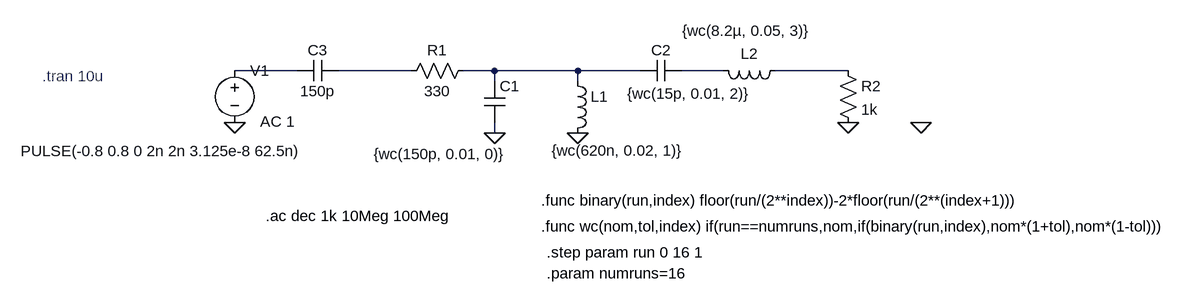
[diagram p0: schematic output filter.asc]
output filter.asc, the LTspice schematic file:
Version 4
SHEET 1 1516 680
WIRE 32 128 -64 128
WIRE 208 128 96 128
WIRE 336 128 288 128
WIRE 464 128 336 128
WIRE 560 128 464 128
WIRE 688 128 624 128
WIRE 880 128 768 128
WIRE 336 144 336 128
WIRE 464 144 464 128
WIRE 336 224 336 208
FLAG 336 224 0
FLAG 464 224 0
FLAG 880 208 0
FLAG 992 208 0
FLAG -64 208 0
SYMBOL voltage -64 112 R0
WINDOW 3 -329 140 Left 2
WINDOW 123 39 94 Left 2
WINDOW 39 0 0 Left 0
SYMATTR InstName V1
SYMATTR Value PULSE(-0.8 0.8 0 2n 2n 3.125e-8 62.5n)
SYMATTR Value2 AC 1
SYMBOL res 304 112 R90
WINDOW 0 0 56 VBottom 2
WINDOW 3 32 56 VTop 2
SYMATTR InstName R1
SYMATTR Value 330
SYMATTR SpiceLine tol=0
SYMBOL cap 320 144 R0
WINDOW 3 -170 112 Left 2
SYMATTR InstName C1
SYMATTR Value {wc(150p, 0.01, 0)}
SYMBOL ind 448 128 R0
WINDOW 3 -24 123 Left 2
SYMATTR InstName L1
SYMATTR Value {wc(620n, 0.02, 1)}
SYMBOL cap 624 112 R90
WINDOW 0 0 32 VBottom 2
WINDOW 3 36 -11 VTop 2
SYMATTR InstName C2
SYMATTR Value {wc(15p, 0.01, 2)}
SYMBOL ind 784 112 R90
WINDOW 0 5 56 VBottom 2
WINDOW 3 -61 61 VTop 2
SYMATTR InstName L2
SYMATTR Value {wc(8.2µ, 0.05, 3)}
SYMBOL res 864 112 R0
SYMATTR InstName R2
SYMATTR Value 1k
SYMBOL cap 96 112 R90
WINDOW 0 0 32 VBottom 2
WINDOW 3 32 32 VTop 2
SYMATTR InstName C3
SYMATTR Value 150p
TEXT -16 352 Left 2 !.ac dec 1k 10Meg 100Meg
TEXT -360 136 Left 2 ;.tran 10u
TEXT 408 328 Left 2 !.func binary(run,index) floor(run/(2**index))-2*floor(run/(2**(index+1)))
TEXT 408 368 Left 2 !.func wc(nom,tol,index) if(run==numruns,nom,if(binary(run,index),nom*(1+tol),nom*(1-tol)))
TEXT 416 408 Left 2 !.step param run 0 16 1
TEXT 416 440 Left 2 !.param numruns=16

The netlist it stands for:
* output filter.asc
V1 N001 0 PULSE(-0.8 0.8 0 2n 2n 3.125e-8 62.5n) AC 1
R1 N003 N002 330 tol=0
C1 N003 0 {wc(150p, 0.01, 0)}
L1 N003 0 {wc(620n, 0.02, 1)}
C2 N004 N003 {wc(15p, 0.01, 2)}
L2 N005 N004 {wc(8.2µ, 0.05, 3)}
R2 N005 0 1k
C3 N002 N001 150p
.ac dec 1k 10Meg 100Meg
* .tran 10u
.func binary(run,index) floor(run/(2**index))-2*floor(run/(2**(index+1)))
.func wc(nom,tol,index) if(run==numruns,nom,if(binary(run,index),nom*(1+tol),nom*(1-tol)))
.step param run 0 16 1
.param numruns=16
.backanno
.end